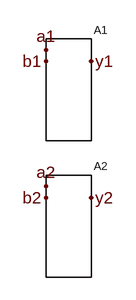
[diagram p0: schematic adevice_two_open.asc]
adevice_two_open.asc, the LTspice schematic file:
Version 4
SHEET 1 880 680
FLAG 64 64 a1
FLAG 64 80 b1
FLAG 128 80 y1
FLAG 64 256 a2
FLAG 64 272 b2
FLAG 128 272 y2
SYMBOL a8 96 64 R0
SYMATTR InstName A1
SYMBOL a8 96 256 R0
SYMATTR InstName A2

The netlist it stands for:
* adevice_two_open.asc
A1 a1 b1 0 0 0 0 y1 0 AND
A2 a2 b2 0 0 0 0 y2 0 AND
.backanno
.end